# Altium schematic sheet USB_data.SchDoc: USB-C 2.0 connector
size A4; DocumentNumber: ADC-SCH-20; SheetNumber: 20; SheetTotal: 20
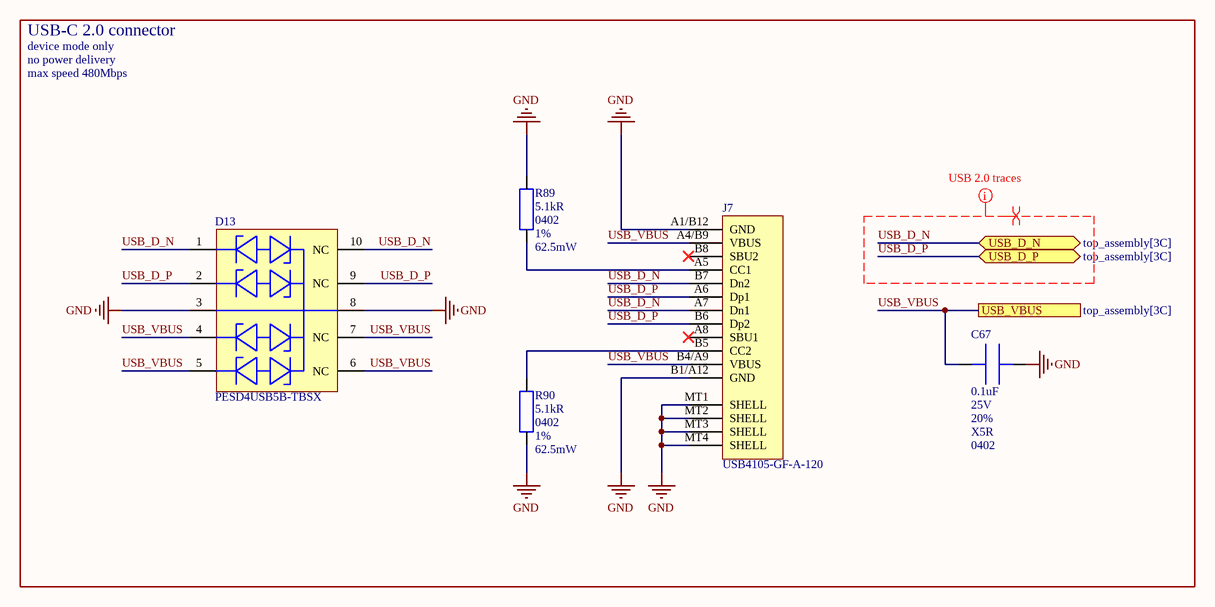
[diagram p0: USB_data.SchDoc]

## Parts
C67  value 0.1uF  Voltage: 25V  Tolerance: 20%  Dielectric: X5R  Package: 0402  [CAPC_0402]  (hidden comment: MSAST105SB5104MFNA01)
D13  PESD4USB5B-TBSX  [DIOC_DFN-2510A-10]
J7  USB4105-GF-A-120  [CONT_USB4105-GF-A-120]
R89  value 5.1kR  Package: 0402  Tolerance: 1%  Power: 62.5mW  [RESC_0402]  (hidden comment: AC0402FR-075K1L)
R90  value 5.1kR  Package: 0402  Tolerance: 1%  Power: 62.5mW  [RESC_0402]  (hidden comment: AC0402FR-075K1L)

## Ports
USB_D_N (bidir, see top_assembly[3C]), USB_D_P (bidir, see top_assembly[3C]), USB_VBUS (see top_assembly[3C])

## Nets
GND: C67.1 D13.3 D13.8 J7.A1/B12(GND) J7.B1/A12(GND) J7.MT1(SHELL) J7.MT2(SHELL) J7.MT3(SHELL) J7.MT4(SHELL) R89.2 R90.2
USB_D_N: D13.1 D13.10(NC) J7.A7(Dn1) J7.B7(Dn2) ; port USB_D_N
USB_D_P: D13.2 D13.9(NC) J7.A6(Dp1) J7.B6(Dp2) ; port USB_D_P
USB_VBUS: C67.2 D13.4 D13.5 D13.6(NC) D13.7(NC) J7.A4/B9(VBUS) J7.B4/A9(VBUS) ; port USB_VBUS
NetJ7_A5: J7.A5(CC1) R89.1
NetJ7_B5: J7.B5(CC2) R90.1

Not connected (* = marked no-connect by the designer): J7 A8(SBU1)* B8(SBU2)*

## Layout directives
mark named USB 2.0 traces: USB_D_N, USB_D_P
differential pair; differential pair class 90OhmDiff: USB_D_N, USB_D_P

## Notes on the sheet
- USB-C 2.0 connector
- device mode only
- no power delivery
- max speed 480Mbps
- Drawn by
- Approved by
- Document type
- Date of issue
- Legal owner
- Title
- Circuit diagram
- File
- AGH Marines
- Document no.
- Revision
- Status
- Sheet
- Size
- Lang.
- /
- A4
- EN

## Library data of the parts
C67 = MSAST105SB5104MFNA01: Multilayer Ceramic Capacitors MLCC - SMD/SMT 25V 0.1uF X5R 0402 20%; Manufacturer: TAIYO YUDEN; Supplier 1: Mouser; Supplier Part Number 1: 963-MSAST105SB5104MF
D13 = PESD4USB5B-TBSX: ESD Protection Diodes / TVS Diodes ESD 5V BI; Manufacturer: Nexperia; Capacitance: 0.3pF; Package: DFN-2510D-10; Voltage: 5V; Supplier 1: Mouser; Supplier Part Number 1: 771-PESD4USB5B-TBSX
J7 = USB4105-GF-A-120: USB Connectors USB Type C, 2.0 SMT PCB Top Mnt 1.20mm; Manufacturer: GCT; Supplier 1: Mouser; Supplier Part Number 1: 640-USB4105-GF-A-120
R89 R90 = AC0402FR-075K1L: Thick Film Resistors - SMD 5.1 kOhms 1/16 W 50 V 1 % 0402 100 PPM / C - 55 C / + 155 C AEC-Q200; Manufacturer: YAGEO; Supplier 1: Mouser; Supplier Part Number 1: 603-AC0402FR-075K1L